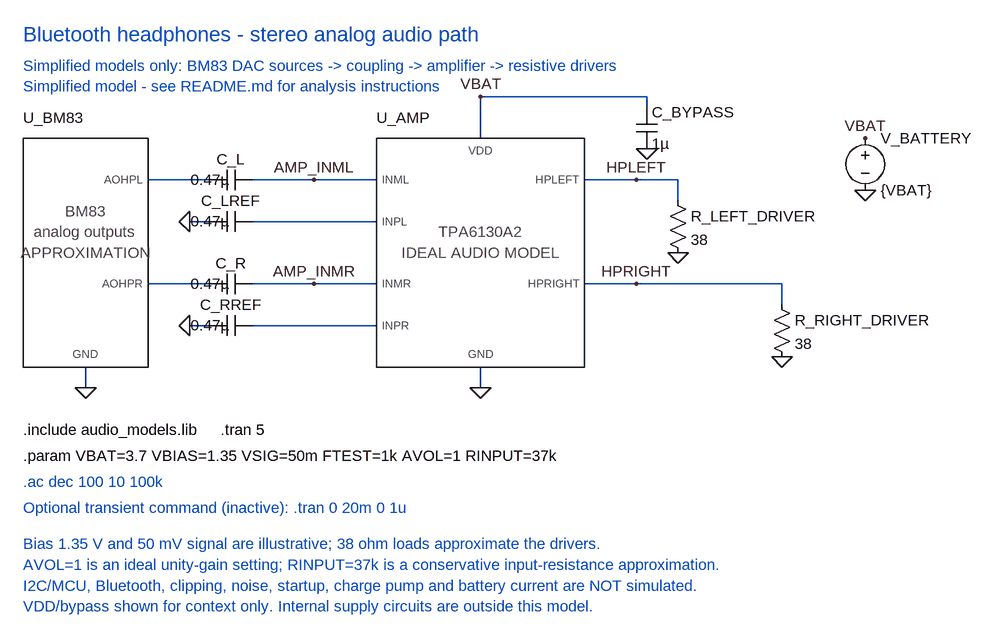
[diagram p0: schematic Headphones_Audio.asc]
Headphones_Audio.asc, the LTspice schematic file:
Version 4.1
SHEET 1 1800 1000
WIRE 1120 128 864 128
WIRE 1120 144 1120 128
WIRE 864 192 864 128
WIRE 448 256 352 256
WIRE 608 256 512 256
WIRE 704 256 608 256
WIRE 1104 256 1024 256
WIRE 1168 256 1104 256
WIRE 1168 288 1168 256
WIRE 448 320 416 320
WIRE 704 320 512 320
WIRE 448 416 352 416
WIRE 608 416 512 416
WIRE 704 416 608 416
WIRE 1104 416 1024 416
WIRE 1328 416 1104 416
WIRE 1328 448 1328 416
WIRE 448 480 416 480
WIRE 704 480 512 480
WIRE 256 576 256 544
WIRE 864 576 864 544
FLAG 256 576 0
FLAG 864 576 0
FLAG 416 320 0
FLAG 416 480 0
FLAG 1168 368 0
FLAG 1328 528 0
FLAG 1120 208 0
FLAG 608 256 AMP_INML
FLAG 608 416 AMP_INMR
FLAG 1104 256 HPLEFT
FLAG 1104 416 HPRIGHT
FLAG 864 128 VBAT
FLAG 1456 192 VBAT
FLAG 1456 272 0
SYMBOL BM83_AUDIO_APPROX 160 192 R0
SYMATTR InstName U_BM83
SYMBOL cap 448 272 R270
WINDOW 0 32 32 VTop 2
WINDOW 3 32 0 VBottom 2
SYMATTR InstName C_L
SYMATTR Value 0.47µ
SYMBOL cap 448 432 R270
WINDOW 0 32 32 VTop 2
WINDOW 3 32 0 VBottom 2
SYMATTR InstName C_R
SYMATTR Value 0.47µ
SYMBOL cap 448 336 R270
WINDOW 0 32 32 VTop 2
WINDOW 3 32 0 VBottom 2
SYMATTR InstName C_LREF
SYMATTR Value 0.47µ
SYMBOL cap 448 496 R270
WINDOW 0 32 32 VTop 2
WINDOW 3 32 0 VBottom 2
SYMATTR InstName C_RREF
SYMATTR Value 0.47µ
SYMBOL TPA6130A2_AUDIO_APPROX 704 192 R0
SYMATTR InstName U_AMP
SYMBOL res 1152 272 R0
SYMATTR InstName R_LEFT_DRIVER
SYMATTR Value 38
SYMBOL res 1312 432 R0
SYMATTR InstName R_RIGHT_DRIVER
SYMATTR Value 38
SYMBOL cap 1104 144 R0
SYMATTR InstName C_BYPASS
SYMATTR Value 1µ
SYMBOL voltage 1456 176 R0
SYMATTR InstName V_BATTERY
SYMATTR Value {VBAT}
TEXT 160 32 Left 3 ;Bluetooth headphones - stereo analog audio path
TEXT 160 80 Left 2 ;Simplified models only: BM83 DAC sources -> coupling -> amplifier -> resistive drivers
TEXT 160 112 Left 2 ;Simplified model - see README.md for analysis instructions
TEXT 160 640 Left 2 !.include audio_models.lib
TEXT 160 680 Left 2 !.param VBAT=3.7 VBIAS=1.35 VSIG=50m FTEST=1k AVOL=1 RINPUT=37k
TEXT 160 720 Left 2 ;.ac dec 100 10 100k
TEXT 160 760 Left 2 ;Optional transient command (inactive): .tran 0 20m 0 1u
TEXT 160 816 Left 2 ;Bias 1.35 V and 50 mV signal are illustrative; 38 ohm loads approximate the drivers.
TEXT 160 848 Left 2 ;AVOL=1 is an ideal unity-gain setting; RINPUT=37k is a conservative input-resistance approximation.
TEXT 160 880 Left 2 ;I2C/MCU, Bluetooth, clipping, noise, startup, charge pump and battery current are NOT simulated.
TEXT 160 912 Left 2 ;VDD/bypass shown for context only. Internal supply circuits are outside this model.
TEXT 464 640 Left 2 !.tran 5

The netlist it stands for:
* Headphones_Audio.asc
X§U_BM83 N001 N003 0 BM83_AUDIO_APPROX  ; pins AOHPL AOHPR GND
C_L N001 AMP_INML 0.47µ
C_R N003 AMP_INMR 0.47µ
C_LREF 0 N002 0.47µ
C_RREF 0 N004 0.47µ
X§U_AMP AMP_INML N002 AMP_INMR N004 HPLEFT HPRIGHT VBAT 0 TPA6130A2_AUDIO_APPROX  ; pins INML INPL INMR INPR HPLEFT HPRIGHT VDD GND
R_LEFT_DRIVER HPLEFT 0 38
R_RIGHT_DRIVER HPRIGHT 0 38
C_BYPASS VBAT 0 1µ
V_BATTERY VBAT 0 {VBAT}
* Bluetooth headphones - stereo analog audio path
* Simplified models only: BM83 DAC sources -> coupling -> amplifier -> resistive drivers
* Simplified model - see README.md for analysis instructions
.include audio_models.lib
.param VBAT=3.7 VBIAS=1.35 VSIG=50m FTEST=1k AVOL=1 RINPUT=37k
* .ac dec 100 10 100k
* Optional transient command (inactive): .tran 0 20m 0 1u
* Bias 1.35 V and 50 mV signal are illustrative; 38 ohm loads approximate the drivers.
* AVOL=1 is an ideal unity-gain setting; RINPUT=37k is a conservative input-resistance approximation.
* I2C/MCU, Bluetooth, clipping, noise, startup, charge pump and battery current are NOT simulated.
* VDD/bypass shown for context only. Internal supply circuits are outside this model.
.tran 5
.backanno
.end